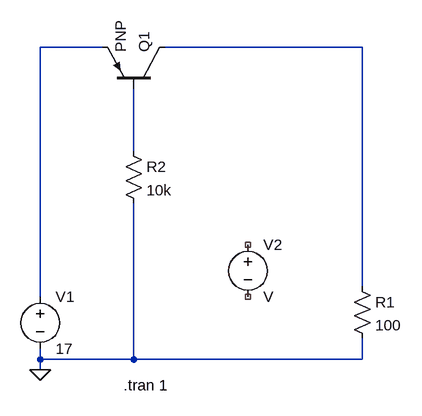
[diagram p0: schematic mosswitchA3.asc]
mosswitchA3.asc, the LTspice schematic file:
Version 4
SHEET 1 888 872
WIRE -32 -208 -128 -208
WIRE 368 -208 64 -208
WIRE 16 -48 16 -144
WIRE 368 160 368 -208
WIRE -128 176 -128 -208
WIRE -128 272 -128 256
WIRE 16 272 16 32
WIRE 16 272 -128 272
WIRE 368 272 368 240
WIRE 368 272 16 272
WIRE -128 288 -128 272
FLAG -128 288 0
SYMBOL voltage -128 160 R0
WINDOW 123 0 0 Left 0
WINDOW 39 0 0 Left 0
SYMATTR InstName V1
SYMATTR Value 17
SYMBOL res 352 144 R0
SYMATTR InstName R1
SYMATTR Value 100
SYMBOL pnp 64 -144 M270
SYMATTR InstName Q1
SYMBOL res 0 -64 R0
SYMATTR InstName R2
SYMATTR Value 10k
SYMBOL voltage 192 80 R0
SYMATTR InstName V2
TEXT 0 312 Left 2 !.tran 1

The netlist it stands for:
* mosswitchA3.asc
V1 N001 0 17
R1 N002 0 100
Q1 N002 N003 N001 0 PNP
R2 N003 0 10k
V2 NC_01 NC_02 V
.model NPN NPN
.model PNP PNP
.lib standard.bjt
.tran 1
.backanno
.end